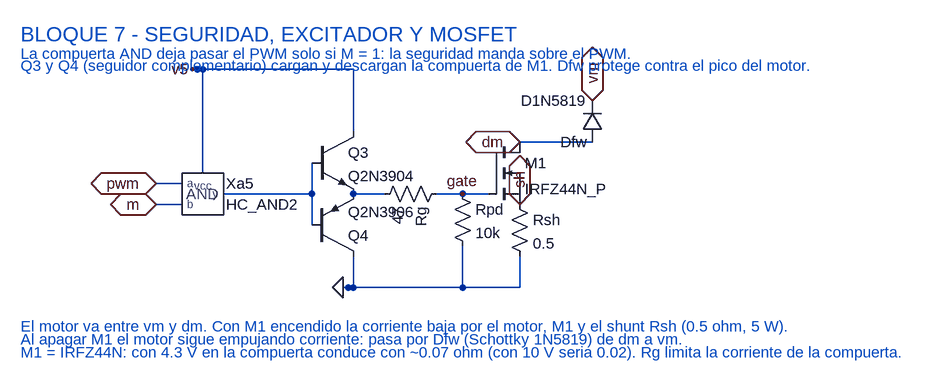
[diagram p0: schematic BLOQUE_POTENCIA.asc]
BLOQUE_POTENCIA.asc, the LTspice schematic file:
Version 4
SHEET 1 1200 800
WIRE 168 80 128 80
WIRE 168 112 128 112
WIRE 232 96 368 96
WIRE 368 48 368 96
WIRE 368 96 368 144
WIRE 432 96 480 96
WIRE 560 96 640 96
WIRE 688 16 800 16
WIRE 184 -96 432 -96
WIRE 184 -96 192 -96
WIRE 432 0 432 -96
WIRE 200 64 200 -96
WIRE 416 240 688 240
WIRE 416 240 424 240
WIRE 432 192 432 240
WIRE 688 192 688 240
WIRE 600 176 600 240
FLAG 128 80 pwm
FLAG 128 112 m
FLAG 600 96 gate
FLAG 688 16 dm
FLAG 688 112 sh
FLAG 800 -48 vm
FLAG 184 -96 v5
FLAG 416 240 0
IOPIN 128 80 BiDir
IOPIN 128 112 BiDir
IOPIN 688 16 BiDir
IOPIN 688 112 BiDir
IOPIN 800 -48 BiDir
SYMBOL HC_AND2 200 96 R0
SYMATTR InstName Xa5
SYMATTR Value HC_AND2
SYMBOL npn 368 0 R0
SYMATTR InstName Q3
SYMATTR Value Q2N3904
SYMBOL pnp 368 192 M180
SYMATTR InstName Q4
SYMATTR Value Q2N3906
SYMBOL res 576 80 R90
SYMATTR InstName Rg
SYMATTR Value 47
SYMBOL res 584 80 R0
SYMATTR InstName Rpd
SYMATTR Value 10k
SYMBOL nmos 640 16 R0
SYMATTR InstName M1
SYMATTR Value IRFZ44N_P
SYMBOL diode 816 16 R180
SYMATTR InstName Dfw
SYMATTR Value D1N5819
SYMBOL res 672 96 R0
SYMATTR InstName Rsh
SYMATTR Value 0.5
TEXT -80 -150 Left 3 ;BLOQUE 7 - SEGURIDAD, EXCITADOR Y MOSFET
TEXT -80 -120 Left 2 ;La compuerta AND deja pasar el PWM solo si M = 1: la seguridad manda sobre el PWM.
TEXT -80 -102 Left 2 ;Q3 y Q4 (seguidor complementario) cargan y descargan la compuerta de M1. Dfw protege contra el pico del motor.
TEXT -80 300 Left 2 ;El motor va entre vm y dm. Con M1 encendido la corriente baja por el motor, M1 y el shunt Rsh (0.5 ohm, 5 W).
TEXT -80 320 Left 2 ;Al apagar M1 el motor sigue empujando corriente: pasa por Dfw (Schottky 1N5819) de dm a vm.
TEXT -80 340 Left 2 ;M1 = IRFZ44N: con 4.3 V en la compuerta conduce con ~0.07 ohm (con 10 V seria 0.02). Rg limita la corriente de la compuerta.

The netlist it stands for:
* BLOQUE_POTENCIA.asc
XXa5 pwm m N001 v5 HC_AND2  ; pins a b y vcc
Q3 v5 N001 N002 0 Q2N3904
Q4 0 N001 N002 0 Q2N3906
Rg gate N002 47
Rpd gate 0 10k
M1 dm gate sh sh IRFZ44N_P
Dfw dm vm D1N5819
Rsh sh 0 0.5
.model D D
.lib standard.dio
.model NPN NPN
.model PNP PNP
.lib standard.bjt
.model NMOS NMOS
.model PMOS PMOS
.lib standard.mos
* BLOQUE 7 - SEGURIDAD, EXCITADOR Y MOSFET
* La compuerta AND deja pasar el PWM solo si M = 1: la seguridad manda sobre el PWM.
* Q3 y Q4 (seguidor complementario) cargan y descargan la compuerta de M1. Dfw protege contra el pico del motor.
* El motor va entre vm y dm. Con M1 encendido la corriente baja por el motor, M1 y el shunt Rsh (0.5 ohm, 5 W).
* Al apagar M1 el motor sigue empujando corriente: pasa por Dfw (Schottky 1N5819) de dm a vm.
* M1 = IRFZ44N: con 4.3 V en la compuerta conduce con ~0.07 ohm (con 10 V seria 0.02). Rg limita la corriente de la compuerta.
.backanno
.end